# Altium schematic sheet Top.SchDoc
size 406 x 304 mm; SheetNumber: 1; SheetTotal: 8
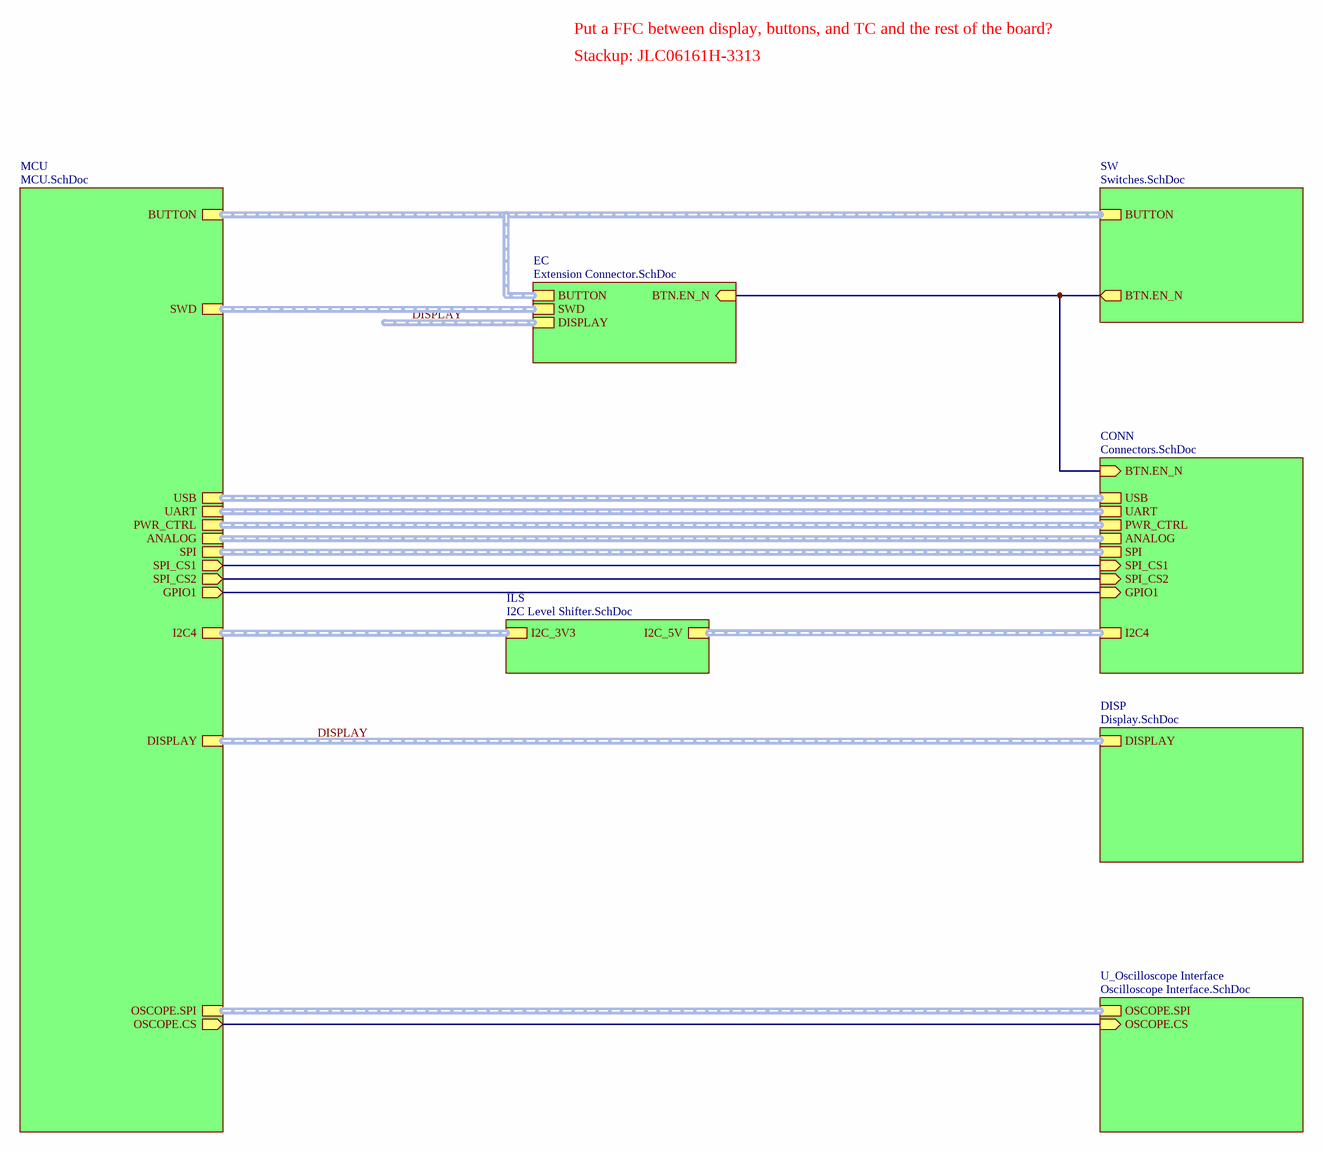
[diagram p0: Top.SchDoc]

## Sub-sheets
CONN = Connectors.SchDoc: USB, UART, PWR_CTRL, ANALOG, SPI, SPI_CS1 (in), SPI_CS2 (in), BTN.EN_N (in), GPIO1 (in), I2C4
DISP = Display.SchDoc: DISPLAY
EC = Extension Connector.SchDoc: BUTTON (harness BTN), BTN.EN_N (in), SWD (harness SWD), DISPLAY
ILS = I2C Level Shifter.SchDoc: I2C_3V3, I2C_5V
MCU = MCU.SchDoc: USB (harness USB), UART (harness UART), PWR_CTRL (harness PWR_CTRL), ANALOG (harness ANALOG), BUTTON (harness BTN), SPI (harness SPI), SPI_CS1 (out), SPI_CS2 (out), DISPLAY (harness I2C), GPIO1 (out), OSCOPE.SPI (harness SPI), OSCOPE.CS (out), I2C4 (harness I2C), SWD (harness SWD)
SW = Switches.SchDoc: BUTTON (harness BTN), BTN.EN_N (out)
U_Oscilloscope Interface = Oscilloscope Interface.SchDoc: OSCOPE.CS (in), OSCOPE.SPI

## Nets
(unnamed): sheet MCU/SPI_CS1, sheet CONN/SPI_CS1
(unnamed): sheet MCU/SPI_CS2, sheet CONN/SPI_CS2
(unnamed): sheet MCU/GPIO1, sheet CONN/GPIO1
(unnamed): sheet MCU/OSCOPE.CS, sheet U_Oscilloscope Interface/OSCOPE.CS
(unnamed): sheet CONN/BTN.EN_N, sheet SW/BTN.EN_N, sheet EC/BTN.EN_N

## Buses and harness runs
harness DISPLAY = sheet DISP/DISPLAY = sheet MCU/DISPLAY
harness DISPLAY = sheet EC/DISPLAY
harness sheet CONN/ANALOG = sheet MCU/ANALOG
harness sheet CONN/I2C4 = sheet ILS/I2C_5V
harness sheet CONN/PWR_CTRL = sheet MCU/PWR_CTRL
harness sheet CONN/SPI = sheet MCU/SPI
harness sheet CONN/UART = sheet MCU/UART
harness sheet CONN/USB = sheet MCU/USB
harness sheet EC/BUTTON = sheet MCU/BUTTON = sheet SW/BUTTON
harness sheet EC/SWD = sheet MCU/SWD
harness sheet ILS/I2C_3V3 = sheet MCU/I2C4
harness sheet MCU/OSCOPE.SPI = sheet U_Oscilloscope Interface/OSCOPE.SPI

## Notes on the sheet
- Put a FFC between display, buttons, and TC and the rest of the board?
- Stackup: JLC06161H-3313
- Sheet Name:
- Date:
- Sheet
- Designer:
- of